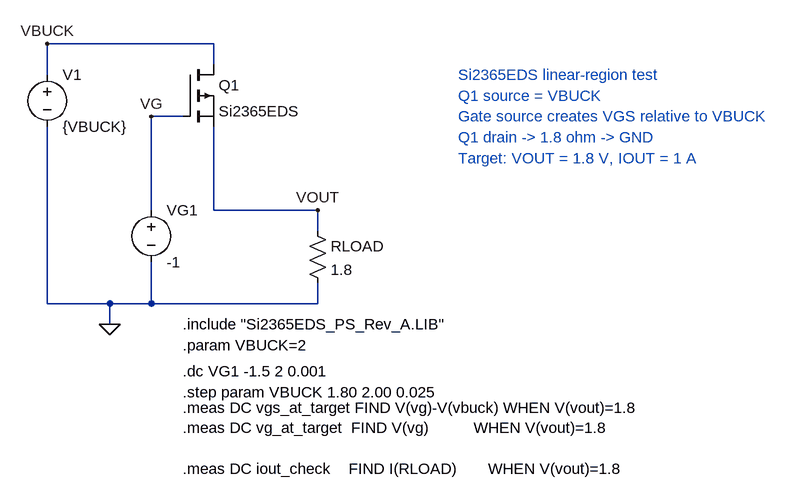
[diagram p0: schematic Si2365EDS_linear_test_fixed.asc]
Si2365EDS_linear_test_fixed.asc, the LTspice schematic file:
Version 4.1
SHEET 1 1020 728
WIRE 144 80 -112 80
WIRE 144 112 144 80
WIRE -112 128 -112 80
WIRE 96 192 48 192
WIRE 48 336 48 192
WIRE 144 336 144 208
WIRE 304 336 144 336
WIRE 304 368 304 336
WIRE -112 480 -112 208
WIRE -16 480 -112 480
WIRE 48 480 48 416
WIRE 48 480 -16 480
WIRE 304 480 304 448
WIRE 304 480 48 480
WIRE -16 512 -16 480
FLAG -112 80 VBUCK
FLAG -16 512 0
FLAG 304 336 VOUT
FLAG 48 192 VG
SYMBOL voltage -112 112 R0
SYMATTR InstName V1
SYMATTR Value {VBUCK}
SYMATTR SpiceLine Rser=0
SYMBOL pmos 96 112 R0
SYMATTR InstName Q1
SYMATTR Value Si2365EDS
SYMATTR Prefix X
SYMBOL voltage 48 320 R0
WINDOW 123 0 0 Left 0
SYMATTR InstName VG1
SYMATTR Value -1
SYMATTR SpiceLine Rser=0
SYMBOL res 288 352 R0
SYMATTR InstName RLOAD
SYMATTR Value 1.8
TEXT 96 512 Left 2 !.include "Si2365EDS_PS_Rev_A.LIB"
TEXT 96 544 Left 2 !.param VBUCK=2
TEXT 96 616 Left 2 !.step param VBUCK 1.80 2.00 0.025
TEXT 520 128 Left 2 ;Si2365EDS linear-region test
TEXT 520 160 Left 2 ;Q1 source = VBUCK
TEXT 520 192 Left 2 ;Gate source creates VGS relative to VBUCK
TEXT 520 224 Left 2 ;Q1 drain -> 1.8 ohm -> GND
TEXT 520 256 Left 2 ;Target: VOUT = 1.8 V, IOUT = 1 A
TEXT 96 584 Left 2 !.dc VG1 -1.5 2 0.001
TEXT 96 640 Left 2 !.meas DC vgs_at_target FIND V(vg)-V(vbuck) WHEN V(vout)=1.8\n.meas DC vg_at_target  FIND V(vg)          WHEN V(vout)=1.8\n\n.meas DC iout_check    FIND I(RLOAD)       WHEN V(vout)=1.8

The netlist it stands for:
* Si2365EDS_linear_test_fixed.asc
V1 VBUCK 0 {VBUCK} Rser=0
X§Q1 VBUCK VG VOUT Si2365EDS  ; pins D G S
VG1 VG 0 -1 Rser=0
RLOAD VOUT 0 1.8
.include "Si2365EDS_PS_Rev_A.LIB"
.param VBUCK=2
.step param VBUCK 1.80 2.00 0.025
* Si2365EDS linear-region test
* Q1 source = VBUCK
* Gate source creates VGS relative to VBUCK
* Q1 drain -> 1.8 ohm -> GND
* Target: VOUT = 1.8 V, IOUT = 1 A
.dc VG1 -1.5 2 0.001
.meas DC vgs_at_target FIND V(vg)-V(vbuck) WHEN V(vout)=1.8
.meas DC vg_at_target  FIND V(vg)          WHEN V(vout)=1.8
.meas DC iout_check    FIND I(RLOAD)       WHEN V(vout)=1.8
.backanno
.end

* Results of the author's LTspice run, read from the files saved beside the schematic
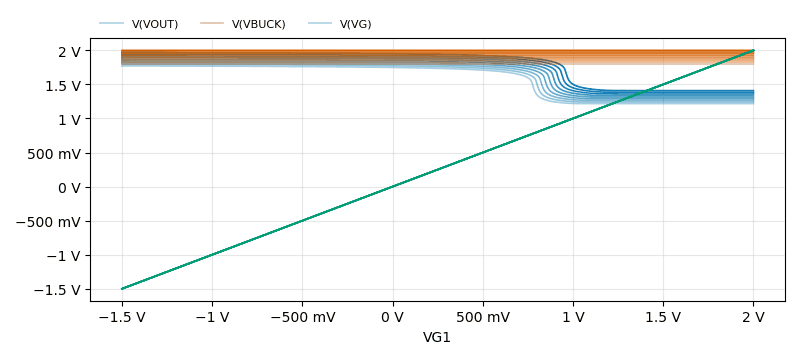
[diagram p1: DC transfer characteristic of Si2365EDS_linear_test_fixed.asc, plotted from the saved traces]
* DC transfer characteristic, 9 runs:
*   V(VOUT) [vbuck=1.8]: 1.772 V at VG1=-1.5 V, 1.218 V at VG1=2 V, min 1.218 V, max 1.772 V
*   V(VOUT) [vbuck=1.825]: 1.797 V at VG1=-1.5 V, 1.242 V at VG1=2 V, min 1.242 V, max 1.797 V
*   V(VOUT) [vbuck=1.85]: 1.822 V at VG1=-1.5 V, 1.266 V at VG1=2 V, min 1.266 V, max 1.822 V
*   V(VOUT) [vbuck=1.875]: 1.847 V at VG1=-1.5 V, 1.289 V at VG1=2 V, min 1.289 V, max 1.847 V
*   V(VOUT) [vbuck=1.9]: 1.871 V at VG1=-1.5 V, 1.313 V at VG1=2 V, min 1.313 V, max 1.871 V
*   V(VOUT) [vbuck=1.925]: 1.896 V at VG1=-1.5 V, 1.337 V at VG1=2 V, min 1.337 V, max 1.896 V
*   V(VOUT) [vbuck=1.95]: 1.921 V at VG1=-1.5 V, 1.361 V at VG1=2 V, min 1.361 V, max 1.921 V
*   V(VOUT) [vbuck=1.975]: 1.946 V at VG1=-1.5 V, 1.385 V at VG1=2 V, min 1.385 V, max 1.946 V
*   V(VBUCK) [vbuck=1.8]: 1.8 V at VG1=-1.5 V, 1.8 V at VG1=2 V, min 1.8 V, max 1.8 V
*   V(VBUCK) [vbuck=1.825]: 1.825 V at VG1=-1.5 V, 1.825 V at VG1=2 V, min 1.825 V, max 1.825 V
*   V(VBUCK) [vbuck=1.85]: 1.85 V at VG1=-1.5 V, 1.85 V at VG1=2 V, min 1.85 V, max 1.85 V
*   V(VBUCK) [vbuck=1.875]: 1.875 V at VG1=-1.5 V, 1.875 V at VG1=2 V, min 1.875 V, max 1.875 V
*   V(VBUCK) [vbuck=1.9]: 1.9 V at VG1=-1.5 V, 1.9 V at VG1=2 V, min 1.9 V, max 1.9 V
*   V(VBUCK) [vbuck=1.925]: 1.925 V at VG1=-1.5 V, 1.925 V at VG1=2 V, min 1.925 V, max 1.925 V
*   V(VBUCK) [vbuck=1.95]: 1.95 V at VG1=-1.5 V, 1.95 V at VG1=2 V, min 1.95 V, max 1.95 V
*   V(VBUCK) [vbuck=1.975]: 1.975 V at VG1=-1.5 V, 1.975 V at VG1=2 V, min 1.975 V, max 1.975 V
*   V(VG) [vbuck=1.8]: -1.5 V at VG1=-1.5 V, 2 V at VG1=2 V, min -1.5 V, max 2 V
*   V(VG) [vbuck=1.825]: -1.5 V at VG1=-1.5 V, 2 V at VG1=2 V, min -1.5 V, max 2 V
*   V(VG) [vbuck=1.85]: -1.5 V at VG1=-1.5 V, 2 V at VG1=2 V, min -1.5 V, max 2 V
*   V(VG) [vbuck=1.875]: -1.5 V at VG1=-1.5 V, 2 V at VG1=2 V, min -1.5 V, max 2 V
*   V(VG) [vbuck=1.9]: -1.5 V at VG1=-1.5 V, 2 V at VG1=2 V, min -1.5 V, max 2 V
*   V(VG) [vbuck=1.925]: -1.5 V at VG1=-1.5 V, 2 V at VG1=2 V, min -1.5 V, max 2 V
*   V(VG) [vbuck=1.95]: -1.5 V at VG1=-1.5 V, 2 V at VG1=2 V, min -1.5 V, max 2 V
*   V(VG) [vbuck=1.975]: -1.5 V at VG1=-1.5 V, 2 V at VG1=2 V, min -1.5 V, max 2 V
* From the log:
*   Measurement: vgs_at_target
*     step  V(vg)-V(vbuck)   at
*        1  failed  0
*        2  failed  0
*        3  -1.85565561706  -0.00565559322034
*        4  -1.44338351044  0.431616484848
*        5  -1.27278080701  0.627219184652
*        6  -1.18324031205  0.74175965338
*        7  -1.13065723239  0.819342813984
*        8  -1.09800067405  0.876999375532
*        9  -1.07730797859  0.922692039381
*   Measurement: vg_at_target
*     step  V(vg)            at
*        1  failed  0
*        2  failed  0
*        3  -0.00565559321604  -0.00565559322034
*        4  0.431616489562  0.431616484848
*        5  0.627219169146  0.627219184652
*        6  0.741759640261  0.74175965338
*        7  0.819342815292  0.819342813984
*        8  0.876999349791  0.876999375532
*        9  0.922692021412  0.922692039381
*   Measurement: iout_check
*     step  I(RLOAD)         at
*        1  failed  0
*        2  failed  0
*        3  0.999999962985  -0.00565559322034
*        4  0.99999995827  0.431616484848
*        5  0.999999991109  0.627219184652
*        6  1.00000003286  0.74175965338
*        7  1.00000003028  0.819342813984
*        8  0.999999993381  0.876999375532
*        9  0.999999960264  0.922692039381